# Altium schematic sheet Power_Regulation.SchDoc
size A4; SheetNumber: 13; SheetTotal: 13
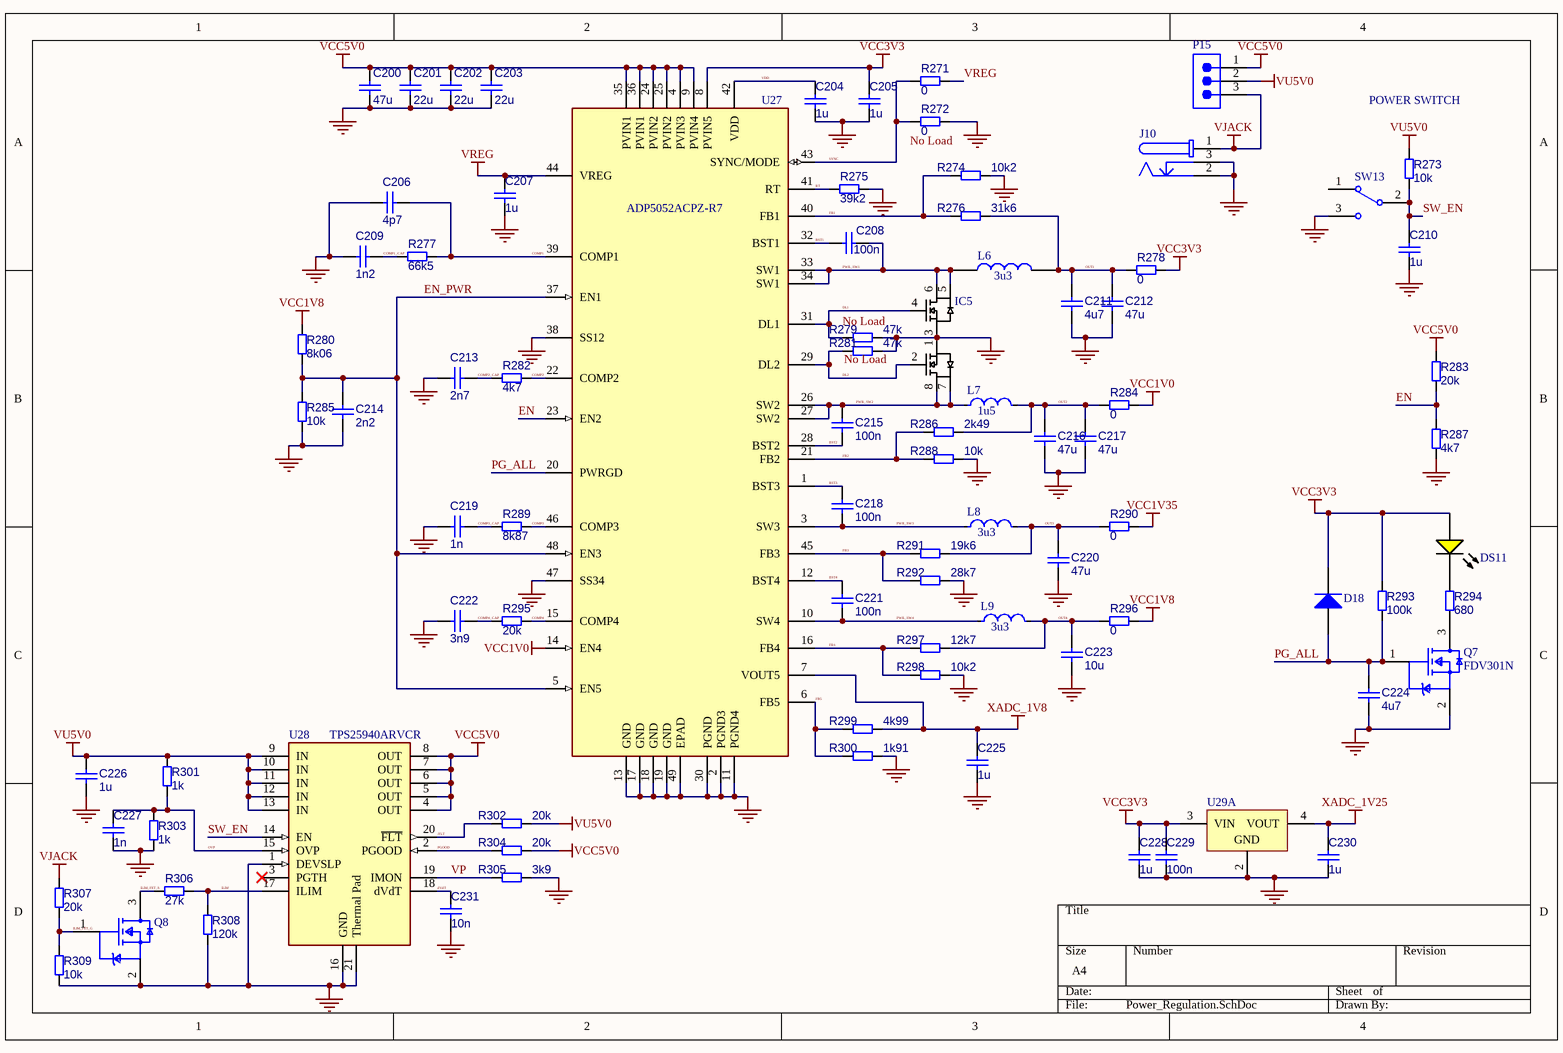
[diagram p0: Power_Regulation.SchDoc]

## Parts
C200  47u  [C_1210]
C201  22u  [C_1210]
C202  22u  [C_1210]
C203  22u  [C_1210]
C204  1u  [C_0402]
C205  1u  [C_0402]
C206  4p7  [CAPC1005X50N_0402]
C207  1u  [C_0402]
C208  100n  [CAPC1005X50N_0402]
C209  1n2  [CAPC1005X50N_0402]
C210  1u  [C_0402]
C211  4u7  [C_0805]
C212  47u  [C_1210]
C213  2n7  [CAPC1005X50N_0402]
C214  2n2  [CAPC1005X50N_0402]
C215  100n  [CAPC1005X50N_0402]
C216  47u  [C_1210]
C217  47u  [C_1210]
C218  100n  [CAPC1005X50N_0402]
C219  1n  [CAPC1005X50N_0402]
C220  47u  [C_1210]
C221  100n  [CAPC1005X50N_0402]
C222  3n9  [CAPC1005X50N_0402]
C223  10u  [C_0805]
C224  4u7  [C_0805]
C225  1u  [C_0402]
C226  1u  [C_0805]
C227  1n  [CAPC1005X50N_0402]
C228  1u  [C_0402]
C229  100n  [CAPC1005X50N_0402]
C230  1u  [C_0402]
C231  10n  [CAPC1005X50N_0402]
D18  BAS16XV2T1G  [ONSC-SOD-523-2-502-01_V]  (value not drawn)
DS11  19-217/Y5C-AM1N1VY/3T  [EVRL-0603-2_V]  (value not drawn)
IC5  FDS9926A  [SOIC127P600X175-8N]  (value not drawn)
J10  694108301002  [694108301002]  (value not drawn)
L6  3u3  [ETQP3M_4M_YFP]
L7  1u5  [FP-IHLP-2020CZ-FP_1_905x2-MFG]
L8  3u3  [FP-IHLP-2020CZ-FP_1_905x2-MFG]
L9  3u3  [FP-IHLP-2020CZ-FP_1_905x2-MFG]
P15  Male Pin Header 1x3 2.54mm  [Copy of Copy of Copy of Copy of Copy of 3M-2340-6111TG_V]  (value not drawn)
Q7  FDV301N  [FP-318-08-MFG]
Q8  FDV301N  [FP-318-08-MFG]  (value not drawn)
R271  0  [R_0402]
R272  0  [R_0402]
R273  10k  [R_0402]
R274  10k2  [R_0402]
R275  39k2  [R_0402]
R276  31k6  [R_0402]
R277  66k5  [R_0402]
R278  0  [R_0402]
R279  47k  [R_0402]
R280  8k06  [R_0402]
R281  47k  [R_0402]
R282  4k7  [R_0402]
R283  20k  [R_0402]
R284  0  [R_0402]
R285  10k  [R_0402]
R286  2k49  [R_0402]
R287  4k7  [R_0402]
R288  10k  [R_0402]
R289  8k87  [R_0402]
R290  0  [R_0402]
R291  19k6  [R_0402]
R292  28k7  [R_0402]
R293  100k  [R_0402]
R294  680  [R_0402]
R295  20k  [R_0402]
R296  0  [R_0402]
R297  12k7  [R_0402]
R298  10k2  [R_0402]
R299  4k99  [R_0402]
R300  1k91  [R_0402]
R301  1k  [R_0402]
R302  20k  [R_0402]
R303  1k  [R_0402]
R304  20k  [R_0402]
R305  3k9  [R_0402]
R306  27k  [R_0402]
R307  20k  [R_0402]
R308  120k  [R_0402]
R309  10k  [R_0402]
SW13  EG1218  [ESWI-EG1218_V]  (value not drawn)
U27  ADP5052ACPZ-R7  [FP-CP-48-13-IPC_B]
U28  TPS25940ARVCR  [FP-RVC0020A-IPC_A]
U29  ADR127BUJZ-REEL7  [ADI-UJ-6_M]  (value not drawn)  (part A of 2)

## Nets
GND: C200.2 C201.2 C202.2 C203.2 C204.1 C205.1 C206.2 C207.1 C209.2 C210.1 C211.1 C212.2 C213.1 C214.2 C216.2 C217.2 C219.1 C220.2 C222.1 C223.1 C224.1 C225.1 C226.1 C227.1 C228.1 C229.1 C230.1 C231.1 IC5.1(S2) IC5.3(S1) J10.2 J10.3 Q7.2(S) Q8.2(S) R272.2 R274.2 R275.2 R279.2 R281.2 R285.2 R287.2 R288.2 R292.2 R298.2 R300.2 R303.1 R305.2 R308.1 R309.1 SW13.3 U27.2(PGND3) U27.11(PGND4) U27.13(GND) U27.17(GND) U27.18(GND) U27.19(GND) U27.30(PGND) U27.38(SS12) U27.47(SS34) U27.49(EPAD) U28.1(DEVSLP) U28.16(GND) U28.21(Thermal_Pad) U29.2(GND)
VCC1V0: R284.1 U27.14(EN4)
VCC1V8: R280.1 R296.1
VCC1V35: R290.1
VCC3V3: C205.2 C228.2 C229.2 D18.1(K) DS11.1(A) R278.1 R293.1 U27.8(PVIN5) U29.3(VIN)
VCC5V0: C200.1 C201.1 C202.1 C203.1 P15.1 R283.1 R304.2 U27.4(PVIN3) U27.9(PVIN4) U27.24(PVIN2) U27.25(PVIN2) U27.35(PVIN1) U27.36(PVIN1) U28.4(OUT) U28.5(OUT) U28.6(OUT) U28.7(OUT) U28.8(OUT)
VJACK: J10.1 P15.3 R307.2
VREG: C207.2 R271.2 U27.44(VREG)
VU5V0: C226.2 P15.2 R273.1 R301.2 R302.2 U28.9(IN) U28.10(IN) U28.11(IN) U28.12(IN) U28.13(IN)
XADC_1V8: C225.2 R299.2 U27.7(VOUT5)
XADC_1V25: C230.2 U29.4(VOUT)
/FLT: R302.1 U28.20(~{FLT})
BST1: C208.1 U27.32(BST1)
BST2: C215.2 U27.28(BST2)
BST3: C218.1 U27.1(BST3)
BST4: C221.1 U27.12(BST4)
COMP1: C206.1 R277.1 U27.39(COMP1)
COMP1_CAP: C209.1 R277.2
COMP2: R282.2 U27.22(COMP2)
COMP2_CAP: C213.2 R282.1
COMP3: R289.2 U27.46(COMP3)
COMP3_CAP: C219.2 R289.1
COMP4: R295.2 U27.15(COMP4)
COMP4_CAP: C222.2 R295.1
DL1: IC5.4(G1) R279.1 U27.31(DL1)
DL2: IC5.2(G2) R281.1 U27.29(DL2)
dVdT: C231.2 U28.18(dVdT)
EN: R283.2 R287.1 U27.23(EN2)
EN_PWR: C214.1 R280.2 R285.1 U27.5(EN5) U27.37(EN1) U27.48(EN3)
FB1: R274.1 R276.1 U27.40(FB1)
FB2: R286.1 R288.1 U27.21(FB2)
FB3: R291.1 R292.1 U27.45(FB3)
FB4: R297.1 R298.1 U27.16(FB4)
FB5: R299.1 R300.1 U27.6(FB5)
ILIM: R306.1 R308.2 U28.17(ILIM)
ILIM_FET_G: Q8.1(G) R307.1 R309.2
ILIM_FET_S: Q8.3(D) R306.2
OUT1: C211.2 C212.1 L6.2 R276.2 R278.2
OUT2: C216.1 C217.1 L7.2 R284.2 R286.2
OUT3: C220.1 L8.2 R290.2 R291.2
OUT4: C223.2 L9.2 R296.2 R297.2
OVP: C227.2 R301.1 R303.2 U28.15(OVP)
PG_ALL: C224.2 D18.2(A) Q7.1(G) R293.2 U27.20(PWRGD)
PGOOD: R304.1 U28.2(PGOOD)
PWR_SW1: C208.2 IC5.5(D1_1) IC5.6(D1_2) L6.1 U27.33(SW1) U27.34(SW1)
PWR_SW2: C215.1 IC5.7(D2_1) IC5.8(D2_2) L7.1 U27.26(SW2) U27.27(SW2)
PWR_SW3: C218.2 L8.1 U27.3(SW3)
PWR_SW4: C221.2 L9.1 U27.10(SW4)
RT: R275.1 U27.41(RT)
SW_EN: C210.2 R273.2 SW13.2(COM) U28.14(EN)
SYNC: R271.1 R272.1 U27.43(SYNC/MODE)
VDD: C204.2 U27.42(VDD)
VP: R305.1 U28.19(IMON)
NetDS11_2: DS11.2(K) R294.1
NetQ7_3: Q7.3(D) R294.2

Not connected (* = marked no-connect by the designer): SW13 1; U28 3(PGTH)*

## Notes on the sheet
- (near R273) POWER SWITCH
- (near R272) No Load
- (near R279) No Load
- (near R281) No Load

## Library data of the parts
C200-C203 C212 C216 C217 C220 = CMP-001-00088-1: 1210, X5R:EIA, 100uF, DC6.3V, GRM32ER60J107ME20
C204 C205 C207 C210 C225 C228 C230 = CMP-001-00085-2: MLCC 0603
C206 C208 C209 C213-C215 C218 C219 C221 C222 C227 C229 C231 = CMP-001-00084-2: MLCC 0402
C211 C223 C224 C226 = CMP-001-00086-2: MLCC 0805
D18 = CMP-1054-00076-1: Switching Diode, 2-Pin SOD-523, Pb-Free, Tape and Reel; Manufacturer: On Semiconductor; trr Max (ns): 6; Configuration: Single; IF Max (A): 0.2; ComponentLink1URL: http://www.onsemi.com/; DatasheetVersion: Rev. 7; RoHS: TRUE; PackageVersion: Rev. E, 09/2010; Packing: Tape and Reel; ComponentLink2Description: Datasheet; ComponentLink2URL: http://www.onsemi.com/pub_link/Collateral/BAS16XV2T1-D.PDF; ComponentLink3Description: Package Specification; PackageReference: SOD-523-2-502-01; ComponentLink1Description: Manufacturer URL; PartNumber: BAS16XV2T1G; Mounting Technology: Surface Mount; PackageDescription: 2-Pin SOD, Body 1.2 x 0.8 mm; ComponentLink3URL: http://www.onsemi.com/pub_link/Collateral/502-01.PDF
DS11 = CMP-007-00005-2: Chip LED, Yellow, 5 V, 25mA, -40 to 85 degC, 2-Pin SMD (0603), RoHS, Tape and Reel; Manufacturer: Everlight Electronics; Datasheet Version: Rev. 1.0, 12/2005; Package Reference: 0603; Mounting Technology: SM; Package Description: 2-Pin Surface Mount Device, Body 1.6 x 0.8 mm; Case/Package: 0603; Datasheet URL: http://www.fairchip.com/pdf/Everlight/19-217-Y5C-AM1N1VY-3T.pdf; Manufacturer URL: http://www.everlight.com/; RoHS Compliant: False
IC5 = FDS9926A: Integrated Circuit; Manufacturer_Name: onsemi; Datasheet Link: https://www.onsemi.com/pub/Collateral/FDS9926A-D.PDF; Height: 1.75mm; Manufacturer_Part_Number: FDS9926A; Mouser Part Number: 512-FDS9926A; Mouser Price/Stock: https://www.mouser.co.uk/ProductDetail/onsemi-Fairchild/FDS9926A?qs=HK%252BeIG1iaagpgrEVRWCDdA%3D%3D; Arrow Part Number: FDS9926A; Arrow Price/Stock: https://www.arrow.com/en/products/fds9926a/on-semiconductor?utm_currency=USD&region=nac
J10 = CMP-1502-00190-4: DC Power Jack Connector WR-DC, Male, Right Angled, THT, 5 A, 24 V; Operating Supply Voltage: 24V; Shielding: Unshielded; Voltage Rating: 30V; Number of Contacts: 3; Insulation Resistance: 100MΩ; Current Rating: 5A; Min Operating Temperature: -40°C; Packaging: Bulk; Connector Type: Power; Housing Material: Polyamide; REACH SVHC: Unknown; Termination: Through Hole; Contact Gender: Female; Mount: Through Hole; RoHS: Compliant; Flammability Rating: UL94 V-0; Height: 11mm; Max Operating Temperature: 85°C; Contact Plating: Tin; Color: Black; Gender: Male; Contact Material: Gold, Tin
L6 = ETQ-P3M3R3YFP: Inductor; Manufacturer_Name: Panasonic; Datasheet Link: https://industrial.panasonic.com/cdbs/www-data/pdf/AGL0000/AGL0000C59.pdf; Height: 4mm; Manufacturer_Part_Number: ETQ-P3M3R3YFP; Mouser Part Number: 667-ETQ-P3M3R3YFP; Mouser Price/Stock: https://www.mouser.co.uk/ProductDetail/Panasonic/ETQ-P3M3R3YFP?qs=sL7MMaRBAPWa%252BM34GljCkQ%3D%3D; Arrow Part Number: ETQ-P3M3R3YFP; Arrow Price/Stock: https://www.arrow.com/en/products/etq-p3m3r3yfp/panasonic.html?utm_currency=USD&region=nac
L7-L9 = CMP-02424-000709-1: Fixed Inductors Commercial High Saturation Series 1.5uH 7.2A 20.7mΩ 20%; Max DC Current: 11A; DC Resistance (DCR): 20.7mR; Core Material: Metal; Shielding: Shielded; Test Frequency: 100kHz; Self Resonant Frequency: 5MHz; Length: 5.49mm; Package Quantity: 2000; Height - Seated (Max): 0.118inch; Inductance Tolerance: 20%; Lead Free: Lead Free; Current Rating: 7.2A; Max Operating Temperature: 125°C; Series: IHLP-2020CZ-01; Termination: SMD/SMT; RoHS Compliant: Yes; Width: 5.18mm; Military Standard: Not; Inductance: 1.5uH; Radiation Hardening: No; Case/Package: 2020; Saturation Current: 11A; Packaging: Tape and Reel; RMS Current (Irms): 7.2A; Tolerance: 20%; Depth: 5.43mm; Min Operating Temperature: -55°C; Mount: Surface Mount; Height: 3mm
P15 = CMP-002-00080-1: Male Header, Pitch 2.54 mm, 1x3 Position, Height 8.636 mm, Tail Length 3.05 mm, -55 to 105 degC, RoHS, Bulk; Manufacturer: 3M; Rows: 1; Current Rating: 3A; Mounting Technology: TH; Contact Plating: Gold; Packaging: Bulk; Lead Pitch: 0.1inch; Case/Package: 2340-6111TG; Contact Material: Copper; Pins: 40; Package Description: Male Header, Pitch 2.54 mm, 1 x 40 Position, Height 8.636 mm, Tail Length 3.05 mm; RoHS Compliant: True; Connector Type: Header; Manufacturer URL: http://www.3m.com/; Contact Finish: Gold; Max Operating Temperature: 105°C; Min Operating Temperature: -55°C; Max Current Rating: 3A; Gender: Male; Package Quantity: 200; Colour: Black; Package Reference: 2340-6111TG; Datasheet URL: https://datasheet.ciiva.com/5161/ts0766-242217-5161112.pdf; Datasheet Version: Aug-08
Q7 Q8 = CMP-2000-04935-2: MOSFET N-CH 25V 220MA SOT-23; Manufacturer: ON Semiconductor; Turn Off Delay Time: 3.5ns; Typ Forward Diode Voltage: 0.8V; Max Junction Temp: +150°C; Threshold Vgs Max: 1.06V; Threshold Vgs Min: 0.7V; Standoff Height: 0.01mm; Max Forward Diode Voltage: 1.2V; Number Of Channels: 1; Rthja Max: 357°C/W; Drain To Source Resistance: 3.1Ω; Input Capacitace At Vds: 9.5pF @ 10V; Gate Charge At Vgs: 0.49nC @ 4.5V; Transconductance: 0.2S; Turn On Delay Time: 3.2ns; Depletion Mode: False; Power Dissipation: 0.35W; Continuous Drain Current: 0.22A; Gate To Source Voltage: 8V; RoHS: TRUE; Lead Free: Yes; Temperature Range High: +150°C; Automotive: No; Height: 1.11mm; Category: Trans; Mouser Description: MOSFET N-Ch Digital; Drain To Source Voltage: 25V; Temperature: -55°C to +150°C; Ipc Land Pattern Name: SOT95P240X100-3; Device Class L1: Discrete Semiconductors; Octopart: https://octopart.com/fdv301n-on+semiconductor-84326713; Footprint Url: https://www.onsemi.com/pub/Collateral/318-08.PDF; Digikey Description: MOSFET N-CH 25V 220MA SOT-23; Drain To Source Breakdown Voltage: 25V; Temperature Range Low: -55°C; Number Of N Channels: 1; Device Class L3: MOSFETs; Package: 318-08; ComponentLink2URL: https://www.onsemi.com/pub/Collateral/FDV301N-D.PDF; Manufacturer Part Number: FDV301N; Device Class L2: Transistors; ComponentLink2Description: Datasheet
R271-R309 = CMP-009-00178-3: Chip 0402 resistor
SW13 = CMP-011-00006-2: Slide Switch, SPDT, 500 V, -20 to 70 degC, 3-Pin THD, RoHS, Bulk; Manufacturer: E-Switch; Voltage Rating (DC): 30V; Current Rating: 200mA; Operating Force: 250gf; Package Quantity: 1000; Contact Plating: Silver; Max Operating Temperature: 70°C; Min Operating Temperature: -20°C; Contact Material: Copper; Datasheet URL: https://www.e-switch.com/system/asset/product_line/data_sheet/119/EG.pdf; Contact Finish: Silver; Case/Package: EG1218; Voltage Rating (AC): 30V; Datasheet Version: Oct-15; Package Description: 3-Pin Through Hole Device, Body 11.6 x 4 mm, Pitch 2.5 mm; RoHS Compliant: True; Package Reference: EG1218; Manufacturer URL: http://www.e-switch.ch/en/; Throw Configuration: SPDT; Contact Current Rating: 200mA; Mounting Technology: TH; Packaging: Bulk; Pins: 3
U27 = CMP-019-00062-1: 5-Channel Integrated Power Solution with Quad Buck Regulators and 200 mA LDO Regulator; Nominal Supply Current: 4.8mA; Output Voltage: 3.305V; Min Supply Voltage: 4.5V; Output Current: 200mA; Max Supply Voltage: 15V; Pins: 48; Max Operating Temperature: 125°C; Mounting Technology: Surface Mount; Min Operating Temperature: -40°C; Case/Package: LFCSP EP
U28 = CMP-019-00063-1: 2.7-V to 18-V, 42mΩ, 0.6-5.2A eFuse with reverse current blocking and DevSleep support 20-WQFN -40 to 85; Output Current: 5.3A; Max Supply Voltage: 18V; Nominal Supply Current: 2.02mA; Min Supply Voltage: 2.7V; Mounting Technology: Surface Mount; Pins: 20; Max Operating Temperature: 85°C; Min Operating Temperature: -40°C
U29 = CMP-0784-00537-1: Precision, Micropower LDO Voltage Reference in TSOT, 1.25 V Output, 2.7 to 18 V Supply, Industrial, 6-pin SOT23 (UJ-6), Reel; Manufacturer: Analog Devices; Max V Supply (V): 18; Vout: 1.25V; Ref Out TC (ppm/C): 3; Min V Supply (V): 2.7; ComponentLink1URL: http://www.analog.com/en/index.html; PartNumber: ADR127BUJZ-REEL7; Operating Temp Range: -40 to 125 degC; ComponentLink4URL: Product URL:http://www.analog.com/en/special-linear-functions/voltage-references/adr127/products/product.html; ComponentLink1Description: Manufacturer URL; Code_JEDEC: MO-193-AA; Packing: Reel; ComponentLink3Description: Package Specification; ComponentLink2URL: http://www.analog.com/static/imported-files/data_sheets/ADR121_125_127.pdf; ComponentLink2Description: Datasheet; DatasheetVersion: Rev. B; Mounting Technology: Surface Mount; PackageReference: UJ-6; PackageDescription: 6-Pin Thin Small Outline Transistor Package, Body 2.9 x 1.6 mm, Pitch 0.95 mm; ComponentLink3URL: http://www.analog.com/static/imported-files/packages/PKG_PDF/TSOT(UJ)/UJ_6.pdf; ComponentLink4Description: URL Link1; PackageVersion: Dec-04